# Altium schematic sheet Master_Schematic.SchDoc
size A4; SheetNumber: 1; SheetTotal: 7
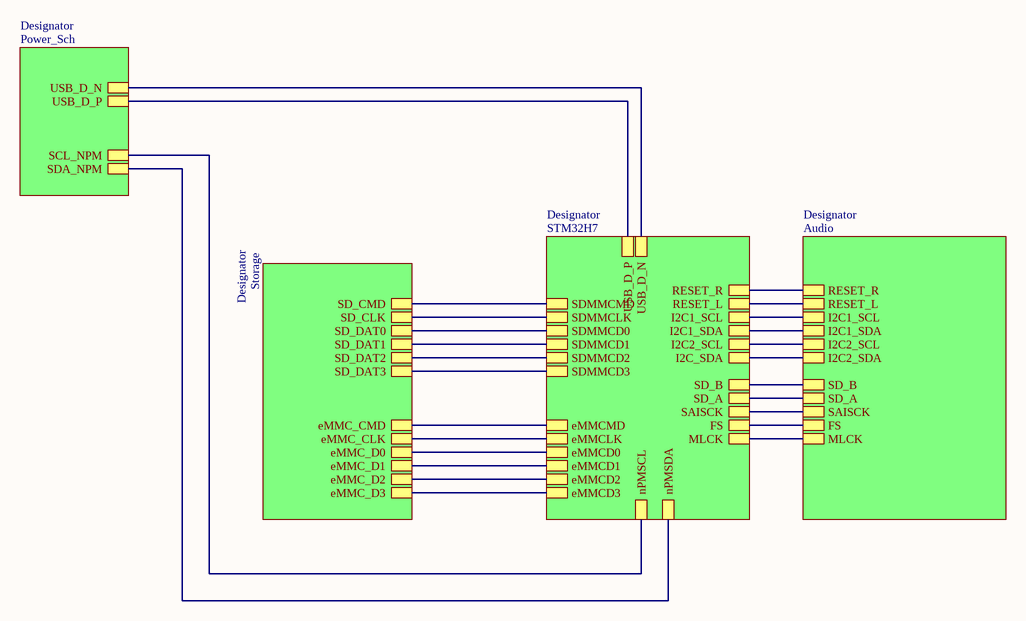
[diagram p0: Master_Schematic.SchDoc]

## Sub-sheets
Designator = STM32H7: eMMCD3, eMMCD2, eMMCD1, eMMCD0, eMMCLK, eMMCMD, SDMMCD1, SDMMCD0, SDMMCD2, SDMMCD3, SDMMCMD, SDMMCLK, RESET_R, RESET_L, I2C_SDA, I2C1_SCL, I2C2_SCL, I2C1_SDA, MLCK, SAISCK, FS, SD_B, SD_A, nPMSDA, nPMSCL, USB_D_N, USB_D_P
Designator = Audio: MLCK, FS, SAISCK, SD_A, SD_B, I2C2_SDA, I2C2_SCL, I2C1_SDA, I2C1_SCL, RESET_R, RESET_L
Designator = Storage: eMMC_CMD, eMMC_CLK, eMMC_D0, eMMC_D1, eMMC_D2, eMMC_D3, SD_CMD, SD_CLK, SD_DAT0, SD_DAT1, SD_DAT2, SD_DAT3
Designator = Power_Sch: SDA_NPM, SCL_NPM, USB_D_P, USB_D_N

## Nets
(unnamed): sheet Designator/eMMCD3, sheet Designator/eMMC_D3
(unnamed): sheet Designator/eMMCD2, sheet Designator/eMMC_D2
(unnamed): sheet Designator/eMMCD1, sheet Designator/eMMC_D1
(unnamed): sheet Designator/eMMCD0, sheet Designator/eMMC_D0
(unnamed): sheet Designator/eMMCLK, sheet Designator/eMMC_CLK
(unnamed): sheet Designator/eMMCMD, sheet Designator/eMMC_CMD
(unnamed): sheet Designator/SDMMCD1, sheet Designator/SD_DAT1
(unnamed): sheet Designator/SDMMCD0, sheet Designator/SD_DAT0
(unnamed): sheet Designator/SDMMCD2, sheet Designator/SD_DAT2
(unnamed): sheet Designator/SDMMCD3, sheet Designator/SD_DAT3
(unnamed): sheet Designator/SDMMCMD, sheet Designator/SD_CMD
(unnamed): sheet Designator/SDMMCLK, sheet Designator/SD_CLK
(unnamed): sheet Designator/RESET_R, sheet Designator/RESET_R
(unnamed): sheet Designator/RESET_L, sheet Designator/RESET_L
(unnamed): sheet Designator/I2C_SDA, sheet Designator/I2C2_SDA
(unnamed): sheet Designator/I2C1_SCL, sheet Designator/I2C1_SCL
(unnamed): sheet Designator/I2C2_SCL, sheet Designator/I2C2_SCL
(unnamed): sheet Designator/I2C1_SDA, sheet Designator/I2C1_SDA
(unnamed): sheet Designator/MLCK, sheet Designator/MLCK
(unnamed): sheet Designator/SAISCK, sheet Designator/SAISCK
(unnamed): sheet Designator/FS, sheet Designator/FS
(unnamed): sheet Designator/SD_B, sheet Designator/SD_B
(unnamed): sheet Designator/SD_A, sheet Designator/SD_A
(unnamed): sheet Designator/nPMSDA, sheet Designator/SDA_NPM
(unnamed): sheet Designator/nPMSCL, sheet Designator/SCL_NPM
(unnamed): sheet Designator/USB_D_N, sheet Designator/USB_D_N
(unnamed): sheet Designator/USB_D_P, sheet Designator/USB_D_P